# Altium schematic sheet HMS.LedCtrl.SchDoc
size A
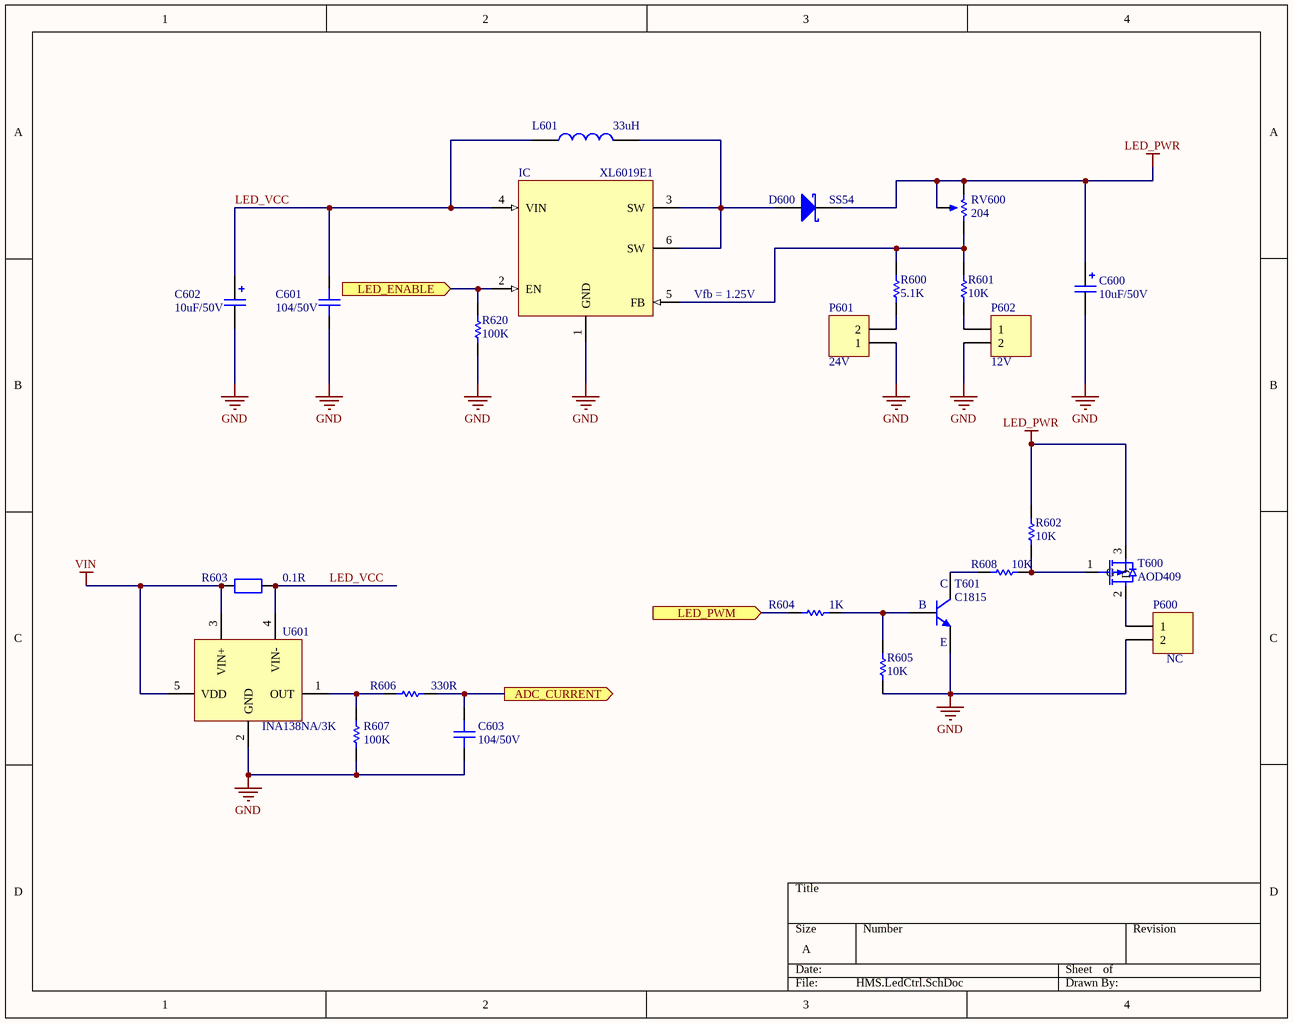
[diagram p0: HMS.LedCtrl.SchDoc]

## Parts
C600  10uF/50V  [CAP_ALUM_SMD_5054_TYPE_C]
C601  104/50V  [CAP_CERAMIC_0402(1005)]
C602  10uF/50V  [CAP_ALUM_SMD_5054_TYPE_C]
C603  104/50V  [CAP_CERAMIC_0402(1005)]
D600  SS54  [DO214AC_SMA_1808]
IC  XL6019E1  [TO-263-5]
L601  33uH  [L3A_10x10x4mm]
P600  NC  [H2_BIG]
P601  24V  [HDR1X2]
P602  12V  [HDR1X2]
R600  5.1K  [RES_0402(1005)]
R601  10K  [RES_0402(1005)]
R602  10K  [RES_0402(1005)]
R603  0.1R  [RES_2512]
R604  1K  [RES_0402(1005)]
R605  10K  [RES_0402(1005)]
R606  330R  [RES_0402(1005)]
R607  100K  [RES_0402(1005)]
R608  10K  [RES_0402(1005)]
R620  100K  [RES_0402(1005)]
RV600  204  [RES_VAR_Type1]
T600  AOD409  [TO252]
T601  C1815  [SOT23-3]
U601  INA138NA/3K  [SOT23-5]

## Ports
ADC_CURRENT (out), LED_ENABLE (in), LED_PWM (in)

## Nets
GND: C600.2 C601.1 C602.2 C603.1 IC.1(GND) P600.2 P601.1 P602.2 R605.1 R607.1 R620.1 T601.2 U601.2(GND)
LED_PWR: C600.1 D600.2(K) R602.2 RV600.2 RV600.3 T600.3(S)
VIN: R603.1 U601.3(VIN+) U601.5(VDD)
ADC_CURRENT: C603.2 R606.2 ; port ADC_CURRENT
LED_ENABLE: IC.2(EN) R620.2 ; port LED_ENABLE
LED_PWM: R604.1 ; port LED_PWM
LED_VCC: C601.2 C602.1 IC.4(VIN) L601.1 R603.2 U601.4(VIN-)
NetD600_1: D600.1(A) IC.3(SW) IC.6(SW) L601.2
NetIC_5: IC.5(FB) R600.2 R601.2 RV600.1
NetP600_1: P600.1 T600.2(D)
NetP601_2: P601.2 R600.1
NetP602_1: P602.1 R601.1
NetR602_1: R602.1 R608.1 T600.1(G)
NetR604_2: R604.2 R605.2 T601.1
NetR606_1: R606.1 R607.2 U601.1(OUT)
NetR608_2: R608.2 T601.3

## Notes on the sheet
- (near IC) Vfb = 1.25V
- (in symbol 2SC1815-HF) C; B; E

## Library data of the parts
C600 C602 = Cap Tantal 2917 (7343-31): Capacitor Alum 10uF/50V SMD 5x5.4mm; MPN: AVS106M50C12T-F; Value: 10uF/50V
C601 = Cap Cer 0805 (2012): CAP CER 0.1UF 50V X5R 0402; MPN: CC0402KRX5R9BB104; Published: 8-Jun-2000; LatestRevisionDate: 17-Jul-2002; LatestRevisionNote: Re-released for DXP Platform.; PackageReference: RAD-0.3; Publisher: Altium Limited; Value: 104/50V
C603 = Cap Cer 0603 (1608): CAP CER 0.1UF 50V X5R 0402; MPN: CC0402KRX5R9BB104; Published: 8-Jun-2000; LatestRevisionDate: 17-Jul-2002; LatestRevisionNote: Re-released for DXP Platform.; PackageReference: RAD-0.3; Publisher: Altium Limited; Value: 104/50V
D600 = Diode B340A: Diode Schottky 5A/40V DO-214AB; Published: 8-Jun-2000; LatestRevisionDate: 17-Jul-2002; LatestRevisionNote: Re-released for DXP Platform.; PackageReference: SMB; Publisher: Altium Limited; Code_JEDEC: DO-214-AA; MPN: SS54; Value: SS54
IC = XL6019E1: XL6019E1 IC Boost 5A TO-263-5; MPN: XL6019E1; Value: XL6019E1
L601 = CBC2012T470M: INDUCTOR 33uH SMD CDRH127-330; Manufacturer: Taiyo Yuden; Inductance: 47uH; Current Rating: 150mA; Current - Saturation: 120mA; Tolerance: ±20%; Shielding: Unshielded; DC Resistance (DCR): 7.54 Ohm Max; Frequency - Self Resonant: 11MHz; Frequency - Test: 2.52MHz; Supplier 1: Digi-Key; Manufacturer Part Number: CBC2012T470M; RoHS: RoHS Compliant; Category: Inductors, Coils, Chokes; Stock 1: 108934; Pricing 1: 1=0.2, 10=0.188, 50=0.1762, 100=0.1645, 500=0.12926, 1000=0.10575 (USD); Packaging: Cut Tape (CT); Type: -; Material - Core: -; Q @ Freq: -; Operating Temperature: -40°C ~ 105°C; Package / Case: 0805 (2012 Metric); Size / Dimension: 0.079" L x 0.049" W x 0.049" H (2.00mm x 1.25mm x 1.25mm); Mounting Type: Surface Mount; ComponentLink1URL: http://www.yuden.co.jp/ut/product/category/inductor/CBC2012T470M.pdf; ComponentLink1Description: http://www.yuden.co.jp/ut/product/category/inductor/CBC2012T470M.pdf; Supplier Part Number 1: 587-1605-1-ND; Value: 33uH; MPN: CDRH127-330
P600 = Header 2: Header, 2-Pin; LatestRevisionDate: 17-Jul-2002; LatestRevisionNote: Re-released for DXP Platform.; Publisher: Altium Limited; Value: NC; MPN: NC
P601 P602 = Header 2: Header, 2-Pin; MPN: NC; LatestRevisionDate: 17-Jul-2002; LatestRevisionNote: Re-released for DXP Platform.; Publisher: Altium Limited
R600 = Res1: RES 5.1K OHM 5% 1/8W 0402; MPN: RC0402JR-075K1L; Published: 8-Jun-2000; LatestRevisionDate: 17-Jul-2002; LatestRevisionNote: Re-released for DXP Platform.; PackageReference: AXIAL-0.3; Publisher: Altium Limited; Value: 5.1K
R601 R602 R605 R608 = Res1: RES 10K OHM 5% 1/8W 0402; MPN: RC0402JR-0710KL; Published: 8-Jun-2000; LatestRevisionDate: 17-Jul-2002; LatestRevisionNote: Re-released for DXP Platform.; PackageReference: AXIAL-0.3; Publisher: Altium Limited; Value: 10K
R603 = Res 1W: Res 1W 0.1R 1% SMD 2512; MPN: RL2512FK-070R1L; Value: 0.1R
R604 = Res1: RES 1K OHM 1% 1/8W 0402; MPN: RC0402FR-071KL; Published: 8-Jun-2000; LatestRevisionDate: 17-Jul-2002; LatestRevisionNote: Re-released for DXP Platform.; PackageReference: AXIAL-0.3; Publisher: Altium Limited; Value: 1K
R606 = Res1: RES 330 OHM 1% 1/8W 0402; MPN: RC0402FR-07330RL; Published: 8-Jun-2000; LatestRevisionDate: 17-Jul-2002; LatestRevisionNote: Re-released for DXP Platform.; PackageReference: AXIAL-0.3; Publisher: Altium Limited; Value: 330R
R607 = Res1: Resistor 100K 1/8W 1% 0402; MPN: RC0402FR-07100KL; Published: 8-Jun-2000; LatestRevisionDate: 17-Jul-2002; LatestRevisionNote: Re-released for DXP Platform.; PackageReference: AXIAL-0.3; Publisher: Altium Limited; Value: 100K
R620 = Res1: RES 100K OHM 5% 1/8W 0402; MPN: RC0402JR-07100KL; Published: 8-Jun-2000; LatestRevisionDate: 17-Jul-2002; LatestRevisionNote: Re-released for DXP Platform.; PackageReference: AXIAL-0.3; Publisher: Altium Limited; Value: 100K
RV600 = Res_Vol_Single: Volume Varistor Single 200K; MPN: 3296W-204; Sim Note: Enter the Resistance value and the set point into parameter fields.; Set Position: 0.5; Published: 8-Jun-2000; LatestRevisionDate: 17-Jul-2002; LatestRevisionNote: Re-released for DXP Platform.; PackageReference: 3296W-204; Publisher: Altium Limited; Value: 204
T600 = AOD4185: MOSFET P-CH 60V 26A TO252; Manufacturer: International Rectifier; FET Type: MOSFET P-Channel, Metal Oxide; FET Feature: Logic Level Gate; Drain to Source Voltage (Vdss): 20V; Current - Continuous Drain (Id) @ 25° C: 3.7A (Ta); Rds On (Max) @ Id, Vgs: 65 mOhm @ 3.7A, 4.5V; Vgs(th) (Max) @ Id: 1.2V @ 250µA; Gate Charge (Qg) @ Vgs: 12nC @ 5V; Input Capacitance (Ciss) @ Vds: 633pF @ 10V; Power - Max: 1.3W; Supplier 1: Digi-Key; RoHS: RoHS Compliant; Category: Discrete Semiconductor Products; Stock 1: 4068; Pricing 1: 1=0.6, 10=0.34, 25=0.2932, 50=0.2468, 100=0.2209, 250=0.20072, 500=0.18058, 1000=0.16904 (USD); Packaging: Digi-Reel®; Mounting Type: Surface Mount; Package / Case: TO-236-3, SC-59, SOT-23-3; Supplier Device Package: Micro3™/SOT-23; ComponentLink1URL: http://www.irf.com/product-info/datasheets/data/irlml6402gpbf.pdf; ComponentLink1Description: http://www.irf.com/product-info/datasheets/data/irlml6402gpbf.pdf; Supplier Part Number 1: IRLML6402GTRPBFDKR-ND; Value: AOD409; MPN: AOD409
T601 = 2SC1815-HF: Trans C1815 NPN 0.15A/50V SMD SOT23; Value: C1815; MPN: 2SC1815
U601 = INA138: IC Current Monitor Regulator 0.5% SOT-23-5; Value: INA138NA/3K; MPN: INA138NA/3K